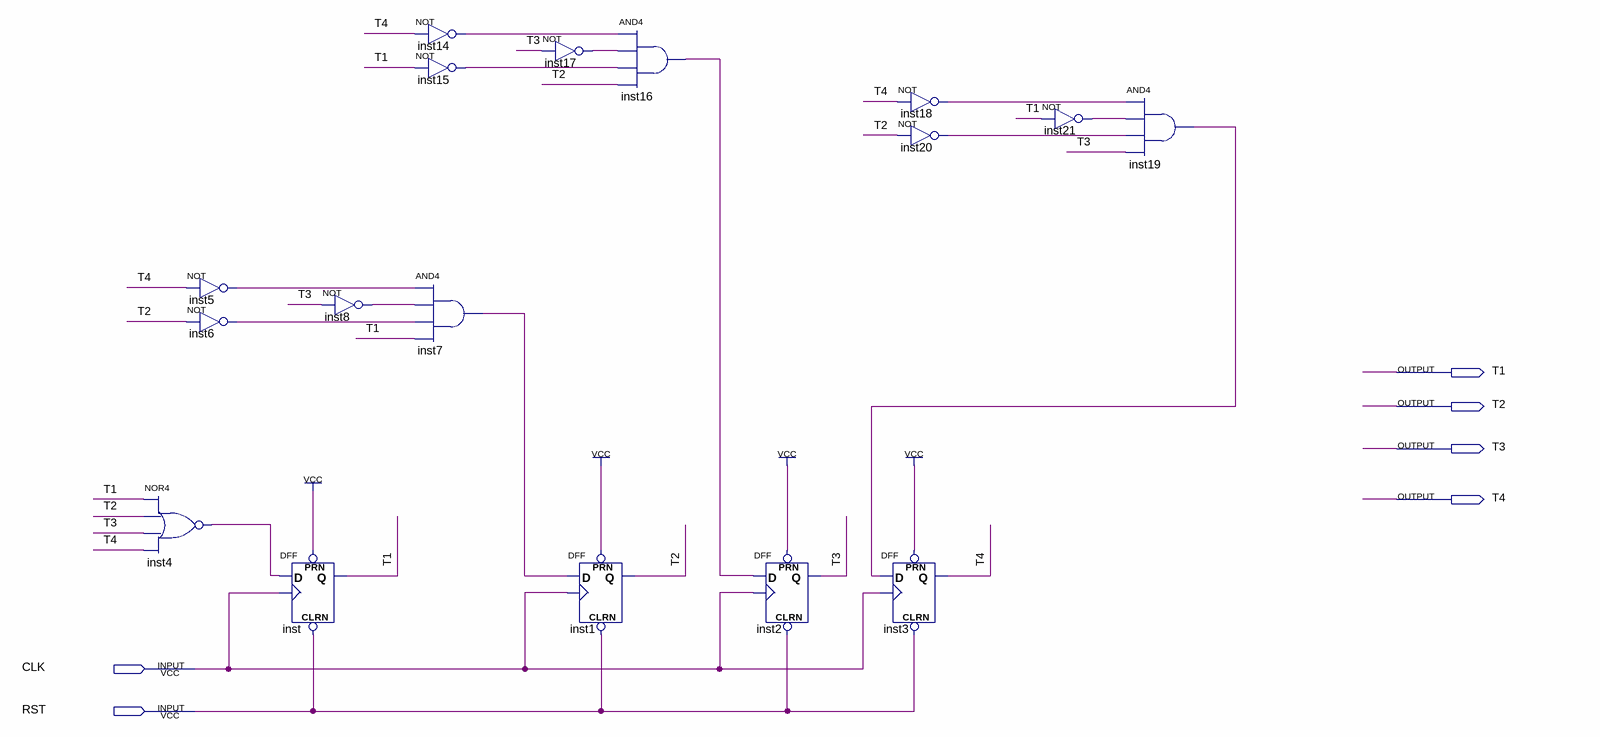
[diagram p0: schematic sheet]
// Quartus schematic FBPG.bdf as structural Verilog: 17 symbols, 6 pins
module FBPG (
  input  CLK,
  input  RST,
  output T1,
  output T2,
  output T3,
  output T4
);

  wire inst4_out, inst5_out, inst6_out, inst7_out, inst8_out, inst14_out, inst15_out, inst16_out, inst17_out,
       inst18_out, inst19_out, inst20_out, inst21_out;

  nor inst4 (inst4_out, T1, T2, T3, T4);
  not inst5 (inst5_out, T4);
  not inst6 (inst6_out, T2);
  DFF inst (.CLRN(RST), .CLK(CLK), .D(inst4_out), .PRN(1'b1), .Q(T1));
  not inst8 (inst8_out, T3);
  not inst14 (inst14_out, T4);
  not inst15 (inst15_out, T1);
  and inst7 (inst7_out, inst5_out, inst8_out, inst6_out, T1);
  not inst17 (inst17_out, T3);
  and inst16 (inst16_out, inst14_out, inst17_out, inst15_out, T2);
  DFF inst1 (.CLRN(RST), .CLK(CLK), .D(inst7_out), .PRN(1'b1), .Q(T2));
  DFF inst2 (.CLRN(RST), .CLK(CLK), .D(inst16_out), .PRN(1'b1), .Q(T3));
  DFF inst3 (.CLRN(RST), .CLK(CLK), .D(inst19_out), .PRN(1'b1), .Q(T4));
  not inst18 (inst18_out, T4);
  not inst20 (inst20_out, T2);
  not inst21 (inst21_out, T1);
  and inst19 (inst19_out, inst18_out, inst21_out, inst20_out, T3);
endmodule
